# Altium schematic sheet 2.Power.SchDoc: TopLevel Schematic
size A3; Date: 21/11/16; Author: Daijun; Revision: 2.0; SheetNumber: 2; SheetTotal: 4; Size: A4; Contact: 0731-88731029
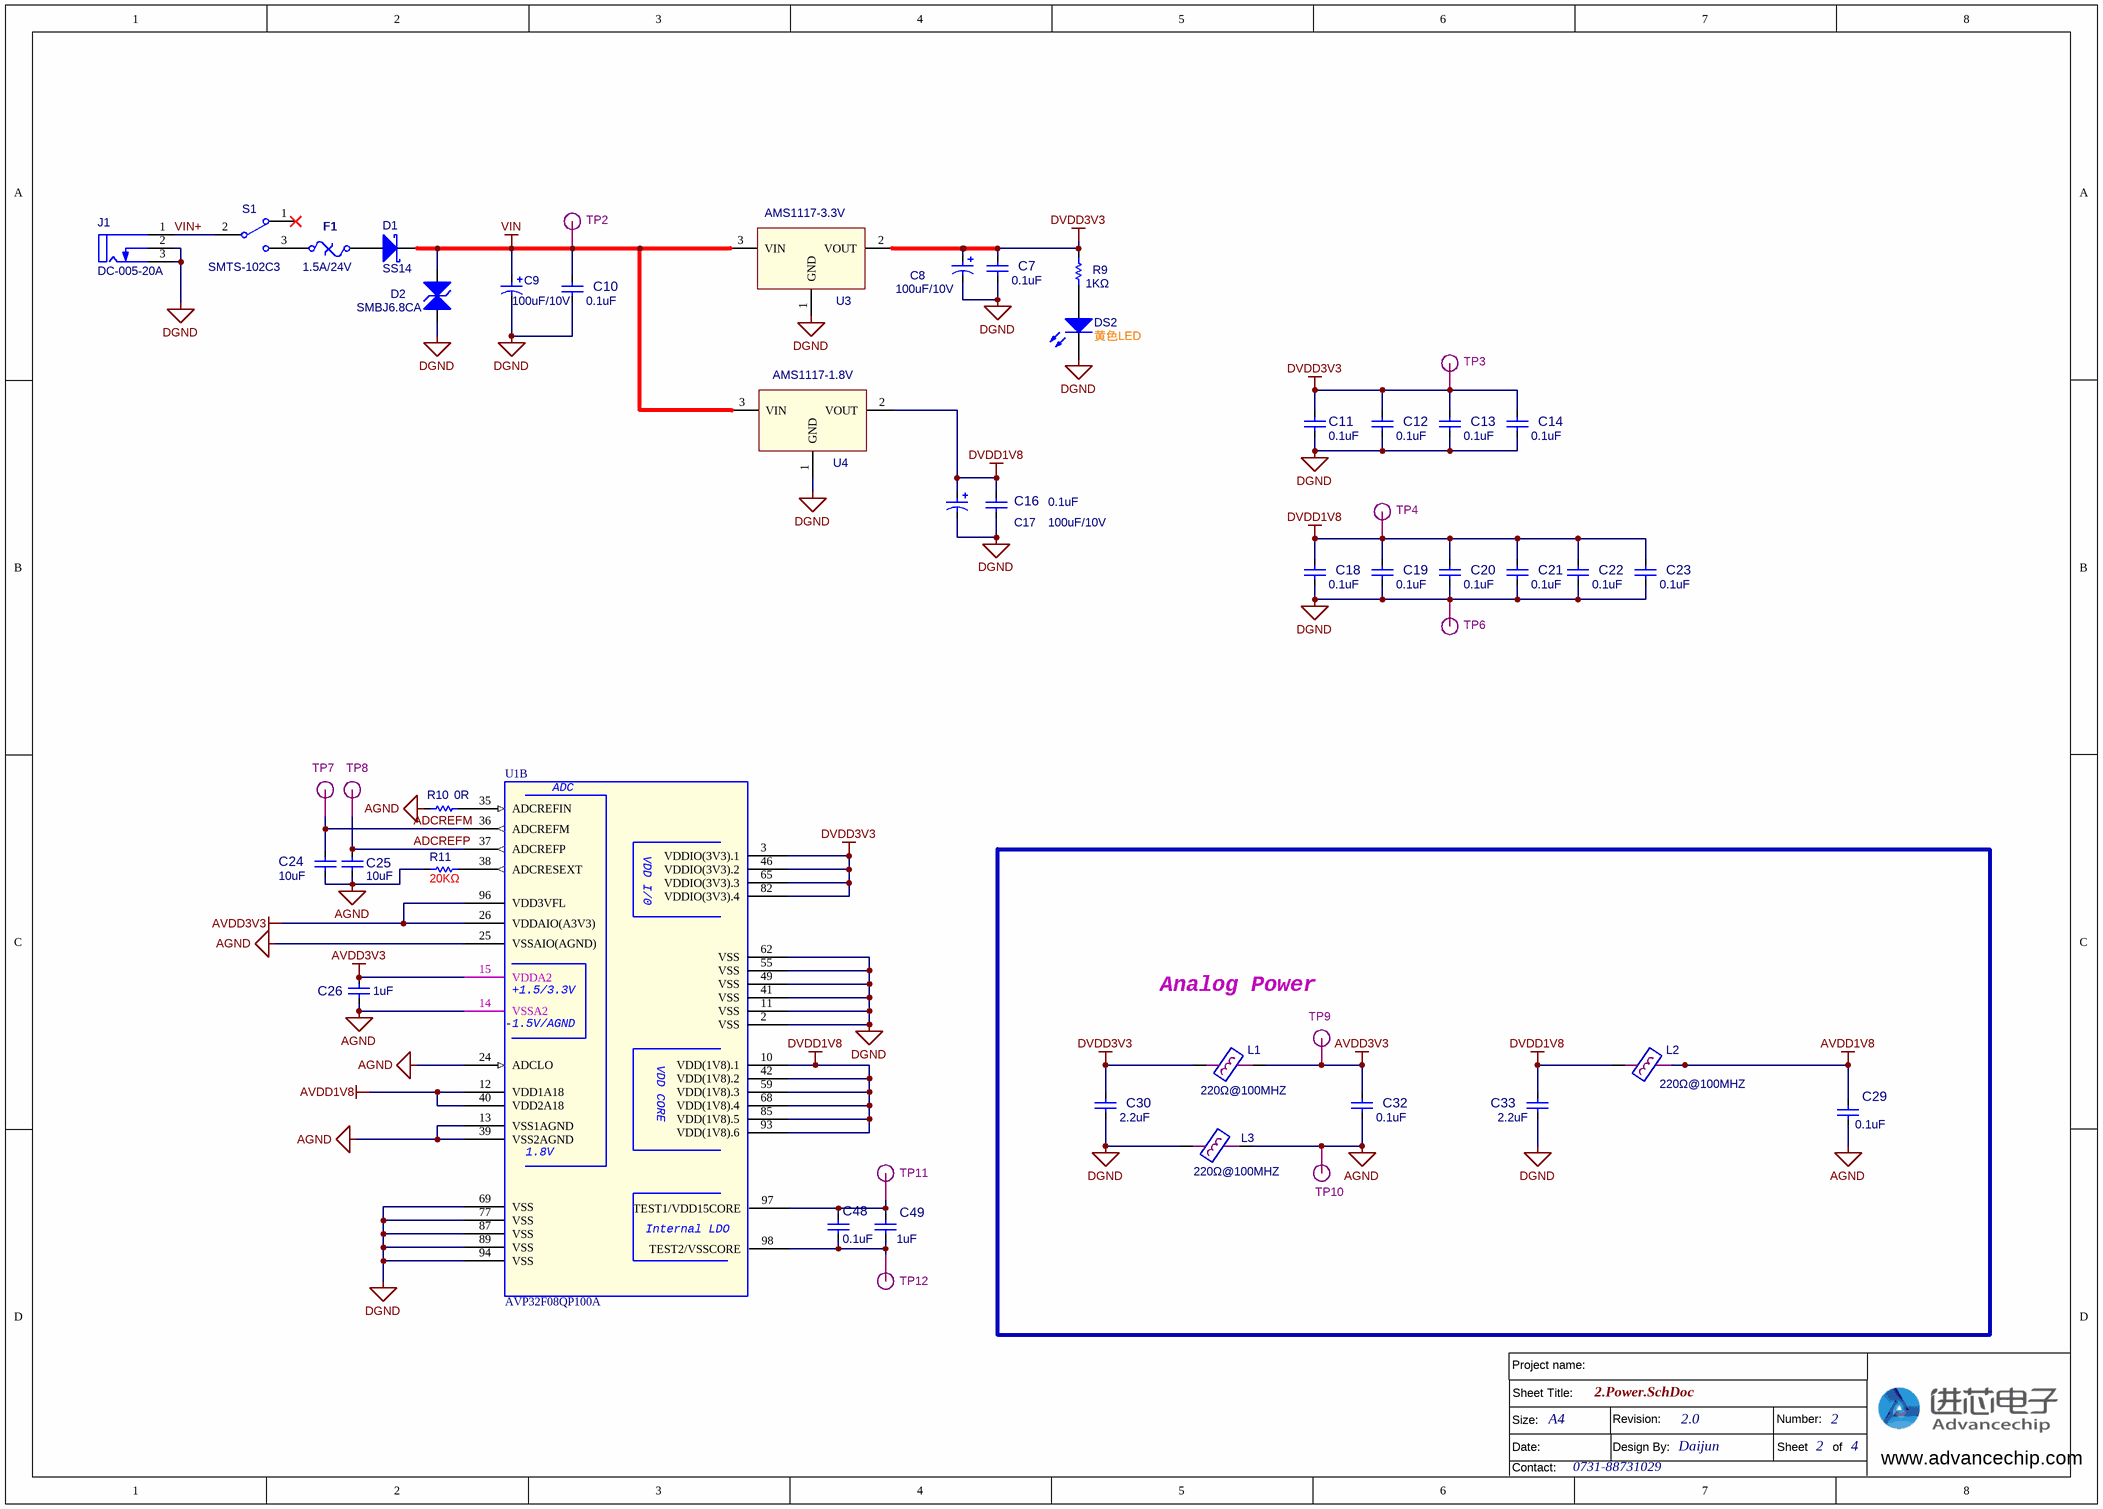
[diagram p0: 2.Power.SchDoc]

## Parts
C7  value 0.1uF  [0603CX]  (hidden comment: 0.1uF/50V)
C8  100uF/10V  [CASE-B-3528]
C9  100uF/10V  [CASE-B-3528]
C10  value 0.1uF  [0603CX]  (hidden comment: 0.1uF/50V)
C11  value 0.1uF  [0603CX]  (hidden comment: 0.1uF/50V)
C12  value 0.1uF  [0603CX]  (hidden comment: 0.1uF/50V)
C13  value 0.1uF  [0603CX]  (hidden comment: 0.1uF/50V)
C14  value 0.1uF  [0603CX]  (hidden comment: 0.1uF/50V)
C16  value 0.1uF  [0603CX]  (hidden comment: 0.1uF/50V)
C17  100uF/10V  [CASE-B-3528]
C18  value 0.1uF  [0603CX]  (hidden comment: 0.1uF/50V)
C19  value 0.1uF  [0603CX]  (hidden comment: 0.1uF/50V)
C20  value 0.1uF  [0603CX]  (hidden comment: 0.1uF/50V)
C21  value 0.1uF  [0603CX]  (hidden comment: 0.1uF/50V)
C22  value 0.1uF  [0603CX]  (hidden comment: 0.1uF/50V)
C23  value 0.1uF  [0603CX]  (hidden comment: 0.1uF/50V)
C24  value 10uF  [C0805]  (hidden comment: 10uF/10V)
C25  value 10uF  [C0805]  (hidden comment: 10uF/10V)
C26  value 1uF  [0603CX]  (hidden comment: 1uF/25V)
C29  value 0.1uF  [0603CX]  (hidden comment: 0.1uF/50V)
C30  value 2.2uF  [0603CX]  (hidden comment: 0.1uF/50V)
C32  value 0.1uF  [0603CX]  (hidden comment: 0.1uF/50V)
C33  value 2.2uF  [0603CX]  (hidden comment: 0.1uF/50V)
C48  value 0.1uF  [0603CX]  (hidden comment: 0.1uF/50V)
C49  value 1uF  [0603CX]  (hidden comment: 1uF/25V)
D1  SS14  [SMA]
D2  SMBJ6.8CA  [SMB2]
DS2  黄色LED  [SMD_LED0805_LED]
F1  1.5A/24V  [1812_PTC_NP]
J1  DC-005-20A  [DC-005]
L1  value 220Ω@100MHZ  [L-0805]  (hidden comment: BLM21PG221SN)
L2  value 220Ω@100MHZ  [L-0805]  (hidden comment: BLM21PG221SN)
L3  value 220Ω@100MHZ  [L-0805]  (hidden comment: BLM21PG221SN)
R9  1KΩ  [0603RX]
R10  0R  [0603RX]
R11  20KΩ  [0603RX]
S1  SMTS-102C3  [SW2]
TP2  VIN+  [TEST-0.8/1.5MM]  (value not drawn)
TP3  +3V3  [TEST-0.8/1.5MM]  (value not drawn)
TP4  +1V8  [TEST-0.8/1.5MM]  (value not drawn)
TP6  DGND  [Keystone5002]  (value not drawn)
TP7  VREFM  [TEST-0.5/1MM]  (value not drawn)
TP8  VREFP  [TEST-0.5/1MM]  (value not drawn)
TP9  AVCC  [Keystone5002]  (value not drawn)
TP10  AGND  [Keystone5002]  (value not drawn)
TP11  +1.5V  [TEST-0.8/1.5MM]  (value not drawn)
TP12  G  [TEST-0.8/1.5MM]  (value not drawn)
U1  AVP32F08QP100A  [LQFP-100]  (part B of 2)
U3  AMS1117-3.3V  [SOT-223]
U4  AMS1117-1.8V  [SOT-223]

## Blocks framed on the sheet
Analog Power: C29 C30 C32 C33 L1-L3 TP9 TP10

## Nets
AGND: C24.2 C25.2 C26.2 C29.2 C32.2 L3.2 R10.1 R11.1 TP10.1 U1.13(VSS1AGND) U1.14(VSSA2) U1.24(ADCLO) U1.25(VSSAIO(AGND)) U1.39(VSS2AGND)
AVDD1V8: C29.1 L2.2 U1.12(VDD1A18) U1.40(VDD2A18)
AVDD3V3: C26.1 C32.1 L1.2 TP9.1 U1.15(VDDA2) U1.26(VDDAIO(A3V3)) U1.96(VDD3VFL)
DGND: C7.2 C8.2 C9.2 C10.2 C11.2 C12.2 C13.2 C14.2 C16.2 C17.2 C18.2 C19.2 C20.2 C21.2 C22.2 C23.2 C30.2 C33.2 D2.1(A) DS2.2(K) J1.2 J1.3 L3.1 TP6.1 U1.2(VSS) U1.11(VSS) U1.41(VSS) U1.49(VSS) U1.55(VSS) U1.62(VSS) U1.69(VSS) U1.77(VSS) U1.87(VSS) U1.89(VSS) U1.94(VSS) U3.1(GND) U4.1(GND)
DVDD1V8: C16.1 C17.1 C18.1 C19.1 C20.1 C21.1 C22.1 C23.1 C33.1 L2.1 TP4.1 U1.10(VDD(1V8).1) U1.42(VDD(1V8).2) U1.59(VDD(1V8).3) U1.68(VDD(1V8).4) U1.85(VDD(1V8).5) U1.93(VDD(1V8).6) U4.2(VOUT)
DVDD3V3: C7.1 C8.1 C11.1 C12.1 C13.1 C14.1 C30.1 L1.1 R9.1 TP3.1 U1.3(VDDIO(3V3).1) U1.46(VDDIO(3V3).2) U1.65(VDDIO(3V3).3) U1.82(VDDIO(3V3).4) U3.2(VOUT)
VIN: C9.1 C10.1 D1.2 D2.2(K) TP2.1 U3.3(VIN) U4.3(VIN)
ADCREFM: C24.1 TP7.1 U1.36(ADCREFM)
ADCREFP: C25.1 TP8.1 U1.37(ADCREFP)
VIN+: J1.1 S1.2
NetC48_1: C48.1 C49.1 TP11.1 U1.97(TEST1/VDD15CORE)
NetC48_2: C48.2 C49.2 TP12.1 U1.98(TEST2/VSSCORE)
NetD1_1: D1.1 F1.2
NetDS2_1: DS2.1(A) R9.2
NetF1_1: F1.1 S1.3
NetR10_2: R10.2 U1.35(ADCREFIN)
NetR11_2: R11.2 U1.38(ADCRESEXT)

Not connected (* = marked no-connect by the designer): S1 1*

## Notes on the sheet
- Sheet Title:
- Project name:
- Size:
- Date:
- Contact:
- Revision:
- Design By:
- Number:
- Sheet       of
- www.advancechip.com
- (in symbol AVP32F08QP100, part B) ADC; VDD I/0; +1.5/3.3V; -1.5V/AGND; VDD CORE; 1.8V; Internal LDO

## Library data of the parts
C7 C10-C14 C16 C18-C26 C29 C30 C32 C33 C48 C49 = Cap: 贴片电容; Published: 8-Jun-2000; LatestRevisionDate: 17-Jul-2002; LatestRevisionNote: Re-released for DXP Platform.; Publisher: Altium Limited
C8 C9 C17 = CAP2: 钽电容; Brand Name: 三星; Tolerance error: 10%; cost: ￥0.01
D1 = D Schottky: 肖特基二极管; Published: 8-Jun-2000; LatestRevisionDate: 17-Jul-2002; LatestRevisionNote: Re-released for DXP Platform.; Publisher: Altium Limited; Code_JEDEC: DO-214-AA
D2 = TVS: TVS二极管; Published: 8-Jun-2000; LatestRevisionDate: 17-Jul-2002; LatestRevisionNote: Re-released for DXP Platform.; Publisher: Altium Limited
DS2 = LED0: 发光二极管; Published: 8-Jun-2000; LatestRevisionDate: 08-Jul-2005; LatestRevisionNote: Mech Layer 1 removed.; PackageReference: LED-0; Publisher: Altium Limited; PackageDescription: LED; 2 Leads
F1 = Fuse Thermal: 自恢复保险丝; Published: 24-Mar-1999; LatestRevisionDate: 17-Jul-2002; LatestRevisionNote: Re-released for DXP Platform.; PackageReference: PIN-W2/E2.8; Publisher: Altium Limited
J1 = DC-005: DC电源接口，内径2.1mm; Published: 24-Mar-1999; LatestRevisionDate: 17-Jul-2002; LatestRevisionNote: Re-released for DXP Platform.; Publisher: Altium Limited
L1-L3 = FB1: 贴片电感BLM21PG221SN; Code_IEC: 1005; Published: 8-Jun-2000; LatestRevisionDate: 29-May-2009; LatestRevisionNote: IPC-7351 Footprint Added.; PackageReference: 0402-A; Publisher: Altium Limited; PackageDescription: Chip Inductor; Code_JEITA: 0402
R9-R11 = Res: 贴片电阻; Value: 1K; Published: 8-Jun-2000; LatestRevisionDate: 17-Jul-2002; LatestRevisionNote: Re-released for DXP Platform.; Publisher: Altium Limited
S1 = SW-SPDT: 红色卧式弯脚小型扭子开关5脚2档; Published: 24-Mar-1999; LatestRevisionDate: 17-Dec-2003; LatestRevisionNote: Schematic revised, PCB Footprint replaced.; DatasheetDocument: 05-Dec-2000; Publisher: Altium Limited
TP2-TP4 TP6-TP12 = TP: 测试点
U1 = AVP32F08QP100: 进芯32位DSP
U3 U4 = ASM1117-3.3V: 线性稳压器